# Altium schematic sheet Connectors.SchDoc
size A4; SheetNumber: 6; SheetTotal: 6
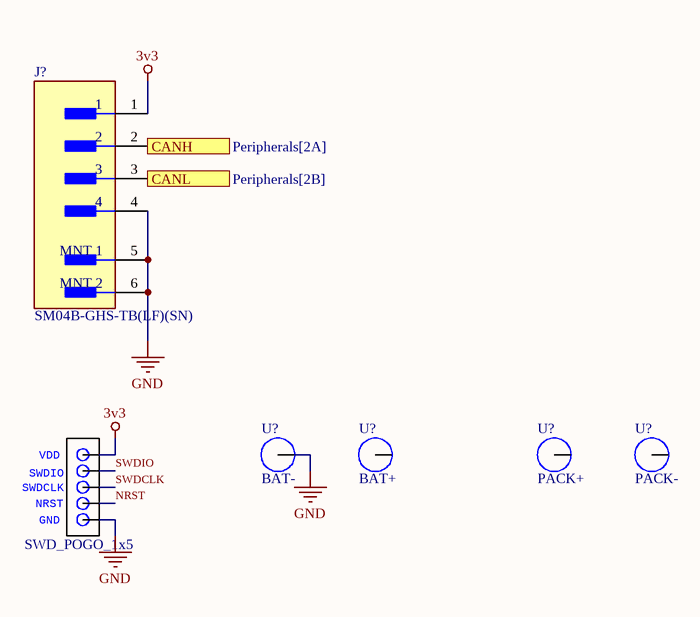
[diagram p0: Connectors.SchDoc]

## Parts
(Parts that share a designator on the sheet are numbered #1, #2 ... from top to bottom, then left to right.)
?  SWD_POGO_1x5  [SWD_pogo_program]
J?  SM04B-GHS-TB(LF)(SN)  [FP-SM04B-GHS-TB_LF_SN-MFG]
U?#1  BAT-
U?#2  BAT+
U?#3  PACK+
U?#4  PACK-

## Ports
CANH (see Peripherals[2A]), CANL (see Peripherals[2B])

## Nets
3v3: J?.1
GND: J?.4 J?.5(MNT_1) J?.6(MNT_2) U?#1.1
CANH: J?.2 ; port CANH
CANL: J?.3 ; port CANL

Not connected (* = marked no-connect by the designer): ? 1 2 3 4 5; U?#2 1; U?#3 1; U?#4 1

## Notes on the sheet
- Title:
- File name:
- Author:
- Reviewed by:
- Last Update:
- Project name:
- Sheet
- out of
- (in symbol SWD_POGO_1x5) VDD; SWDIO; SWDCLK; NRST; GND

## Library data of the parts
J? = f4320a1371cd6270e33bce1916c33c0: Connector Header, GH Series, 4 Position, 1.25mm, 30-26 AWG, 50V, Surface Mount, Right Angle, Solder, Locking Ramp
U?#1-U?#4 = PowerPad: Value: *; HelpURL: *; MPN: *; classname: *